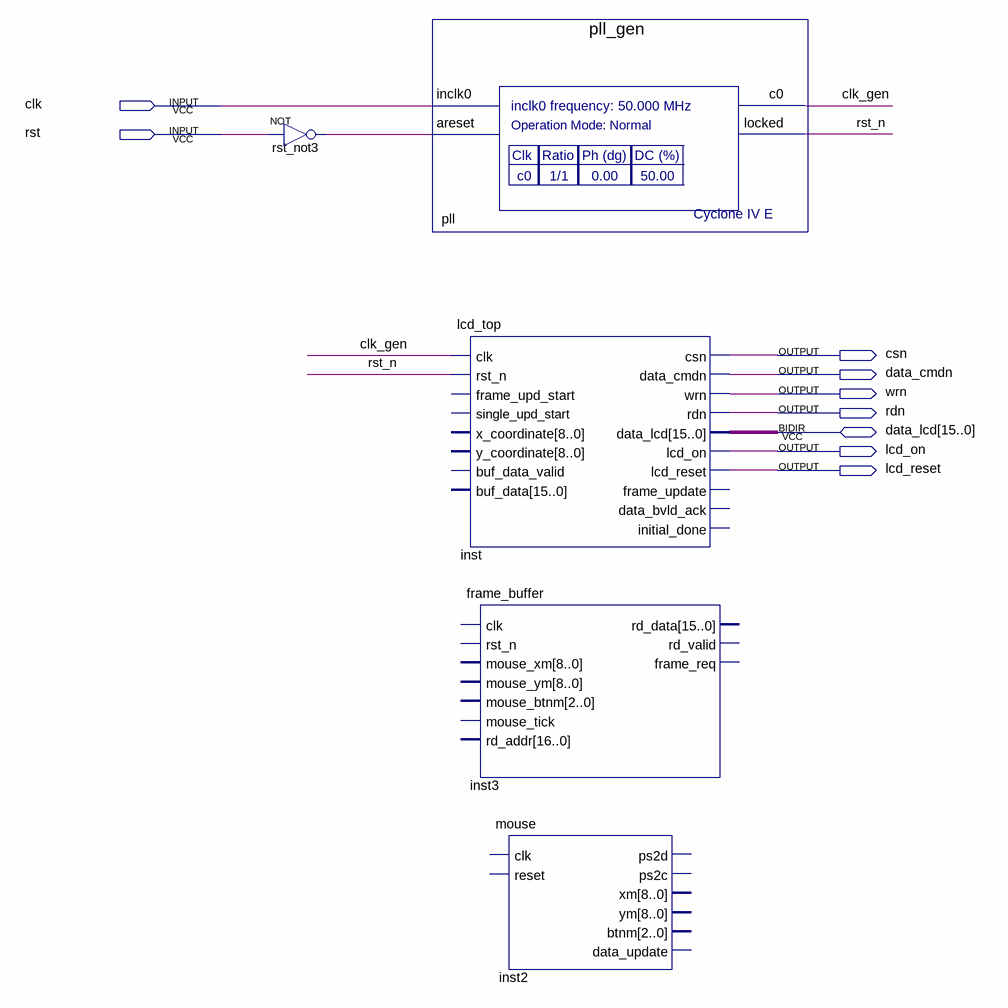
[diagram p0: schematic sheet]
// Quartus schematic graphic_pad.bdf as structural Verilog: 5 symbols, 9 pins
module graphic_pad (
  input  clk,
  input  rst,
  inout  [15:0] data_lcd,
  output csn,
  output data_cmdn,
  output wrn,
  output rdn,
  output lcd_on,
  output lcd_reset
);

  wire clk_gen, rst_n, rst_not3_out;

  not rst_not3 (rst_not3_out, rst);
  pll_gen pll (.inclk0(clk), .areset(rst_not3_out), .c0(clk_gen), .locked(rst_n));
  lcd_top inst (
    .clk(clk_gen), .rst_n(rst_n), .csn(csn), .data_cmdn(data_cmdn), .wrn(wrn), .rdn(rdn), .lcd_on(lcd_on),
    .lcd_reset(lcd_reset), .data_lcd(data_lcd));  // open: frame_upd_start, single_upd_start, x_coordinate, y_coordinate, buf_data_valid, buf_data, frame_update, data_bvld_ack, initial_done
  frame_buffer inst3 ();  // open: clk, rst_n, mouse_xm, mouse_ym, mouse_btnm, mouse_tick, rd_addr, rd_data, rd_valid, frame_req
  mouse inst2 ();  // open: clk, reset, xm, ym, btnm, data_update, ps2d, ps2c
endmodule
